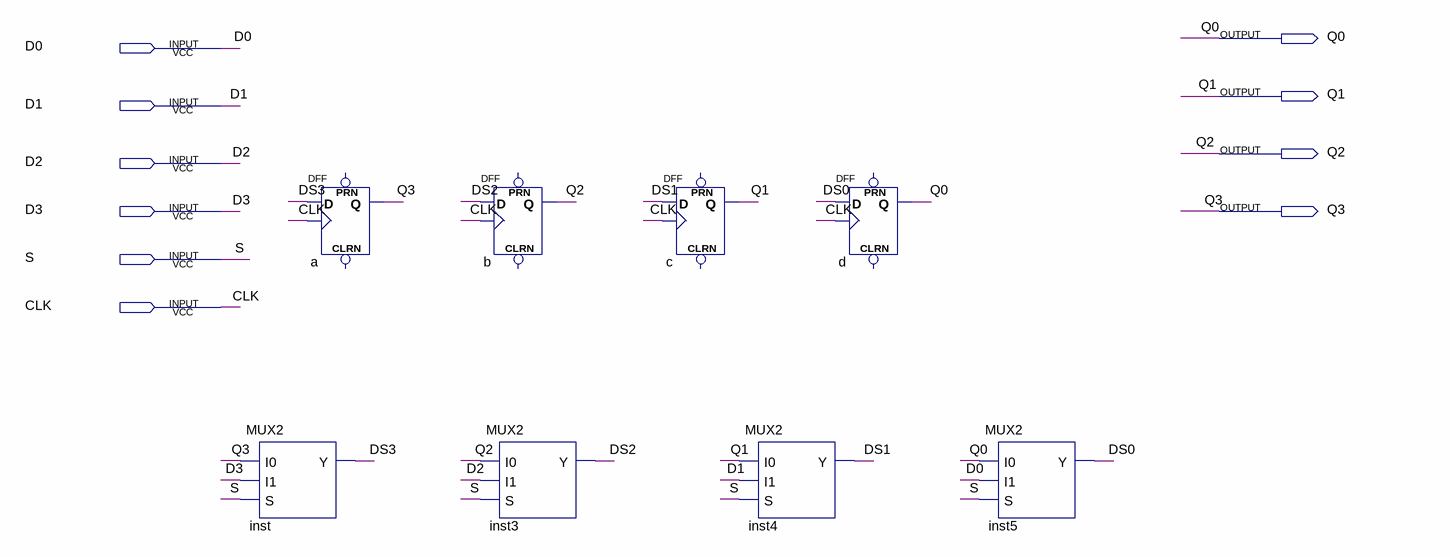
[diagram p0: schematic sheet]
// Quartus schematic Reg4.bdf as structural Verilog: 8 symbols, 10 pins
module Reg4 (
  input  D0,
  input  D1,
  input  D2,
  input  D3,
  input  S,
  input  CLK,
  output Q0,
  output Q1,
  output Q2,
  output Q3
);

  wire DS0, DS1, DS2, DS3;

  MUX2 inst (.I0(Q3), .I1(D3), .S(S), .Y(DS3));
  DFF a (.CLK(CLK), .D(DS3), .Q(Q3));  // open: CLRN, PRN
  DFF b (.CLK(CLK), .D(DS2), .Q(Q2));  // open: CLRN, PRN
  MUX2 inst3 (.I0(Q2), .I1(D2), .S(S), .Y(DS2));
  DFF c (.CLK(CLK), .D(DS1), .Q(Q1));  // open: CLRN, PRN
  MUX2 inst4 (.I0(Q1), .I1(D1), .S(S), .Y(DS1));
  DFF d (.CLK(CLK), .D(DS0), .Q(Q0));  // open: CLRN, PRN
  MUX2 inst5 (.I0(Q0), .I1(D0), .S(S), .Y(DS0));
endmodule
